# Altium project AirSensor.PrjPcb
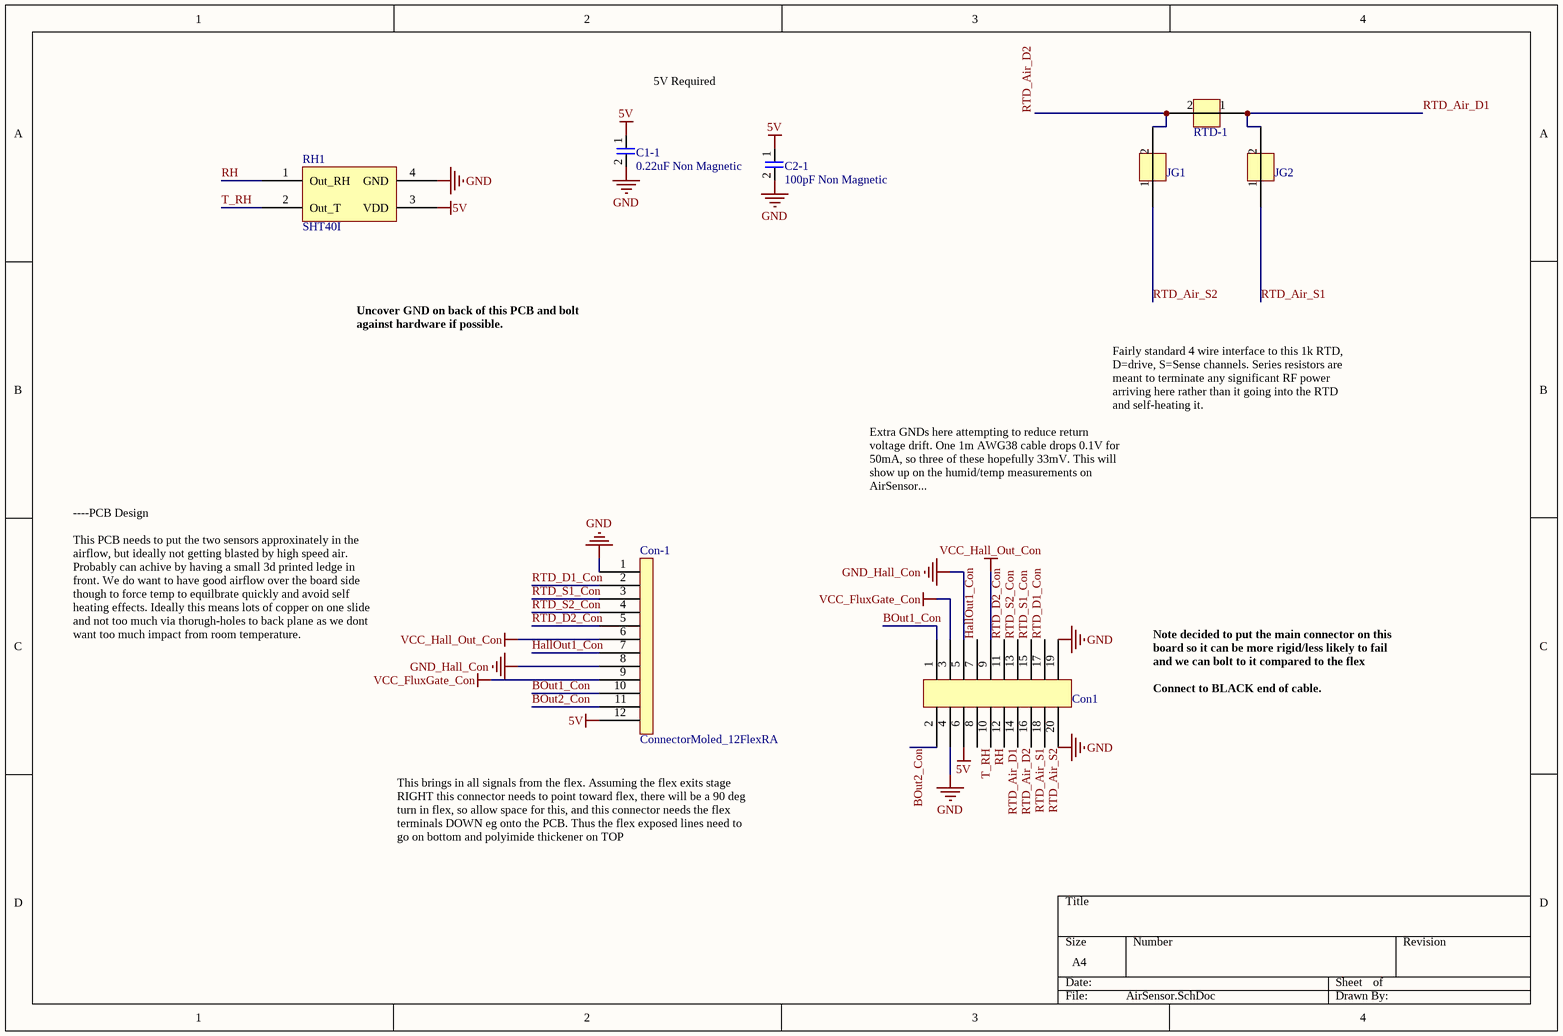
[diagram p0: AirSensor.SchDoc]
1 sheet, 8 parts. Net scope: global (net labels, ports and power ports of the same name join across sheets).
Board file: AirSensor.PcbDoc

## Sheet AirSensor.SchDoc
size A4; SheetNumber: 1; SheetTotal: 1

### Parts
C1-1  0.22uF Non Magnetic  [0805_Compact]
C2-1  100pF Non Magnetic  [0402]
Con1  Connector_LSHM_110  [Connector_LSHM_110]  (value not drawn)
Con-1  ConnectorMoled_12FlexRA  [Connector_Molex_12Flex_RA]
JG1  Jumper_Ground_Tiny  [GndConnectorTiny]  (value not drawn)
JG2  Jumper_Ground_Tiny  [GndConnectorTiny]  (value not drawn)
RH1  SHT40I  [4-WDFN]
RTD-1  RTD_SMD  [0603]  (value not drawn)

### Nets
5V: C1-1.1 C2-1.1 Con1.6 Con-1.12(VCC) RH1.3(VDD)
GND: C1-1.2 C2-1.2 Con1.4 Con1.19 Con1.20 Con-1.1(VCC) RH1.4(GND)
GND_Hall_Con: Con1.5 Con-1.8(VCC)
VCC_FluxGate_Con: Con1.3 Con-1.9(VCC)
VCC_Hall_Out_Con: Con1.9 Con-1.6(VCC)
BOut1_Con: Con1.1 Con-1.10(VCC)
BOut2_Con: Con1.2 Con-1.11(VCC)
HallOut1_Con: Con1.7 Con-1.7(VCC)
RH: Con1.10 RH1.1(Out_RH)
RTD_Air_D1: Con1.12 JG2.2 RTD-1.1
RTD_Air_D2: Con1.14 JG1.2 RTD-1.2
RTD_Air_S1: Con1.16 JG2.1
RTD_Air_S2: Con1.18 JG1.1
RTD_D1_Con: Con1.17 Con-1.2(VCC)
RTD_D2_Con: Con1.11 Con-1.5(VCC)
RTD_S1_Con: Con1.15 Con-1.3(VCC)
RTD_S2_Con: Con1.13 Con-1.4(VCC)
T_RH: Con1.8 RH1.2(Out_T)

### Notes on the sheet
- 5V Required
- Uncover GND on back of this PCB and bolt against hardware if possible.
- Fairly standard 4 wire interface to this 1k RTD, D=drive, S=Sense channels. Series resistors are meant to terminate any significant RF power arriving here rather than it going into the RTD and self-heating it.
- Extra GNDs here attempting to reduce return voltage drift. One 1m AWG38 cable drops 0.1V for 50mA, so three of these hopefully 33mV. This will show up on the humid/temp measurements on AirSensor...
- ----PCB Design
  This PCB needs to put the two sensors approxinately in the airflow, but ideally not getting blasted by high speed air. Probably can achive by having a small 3d printed ledge in front. We do want to have good airflow over the board side though to force temp to equilbrate quickly and avoid self heating effects. Ideally this means lots of copper on one slide and not too much via thorugh-holes to back plane as we dont want too much impact from room temperature.
- Note decided to put the main connector on this board so it can be more rigid/less likely to fail and we can bolt to it compared to the flex
  Connect to BLACK end of cable.
- This brings in all signals from the flex. Assuming the flex exits stage RIGHT this connector needs to point toward flex, there will be a 90 deg turn in flex, so allow space for this, and this connector needs the flex terminals DOWN eg onto the PCB. Thus the flex exposed lines need to go on bottom and polyimide thickener on TOP

### Library data of the parts
C1-1 C2-1 = Capacitor1
  C1-1: Digikey P/N: 1608-1296-1-ND
  C2-1: Digikey P/N: 1608-1288-1-ND
Con1 = Connector_LSHM_110: Digikey P/N: SAM15998CT-ND
Con-1 = ConnectorMoled_12FlexRA: Digikey P/N: 900-5051101297CT-ND
RH1 = SHT40I: Digikey P/N: 1649-SHT40I-HD1F-R2CT-ND
RTD-1 = RTD_SMD: Digikey P/N: 2952-P1K0.0603.3FC.B-ND